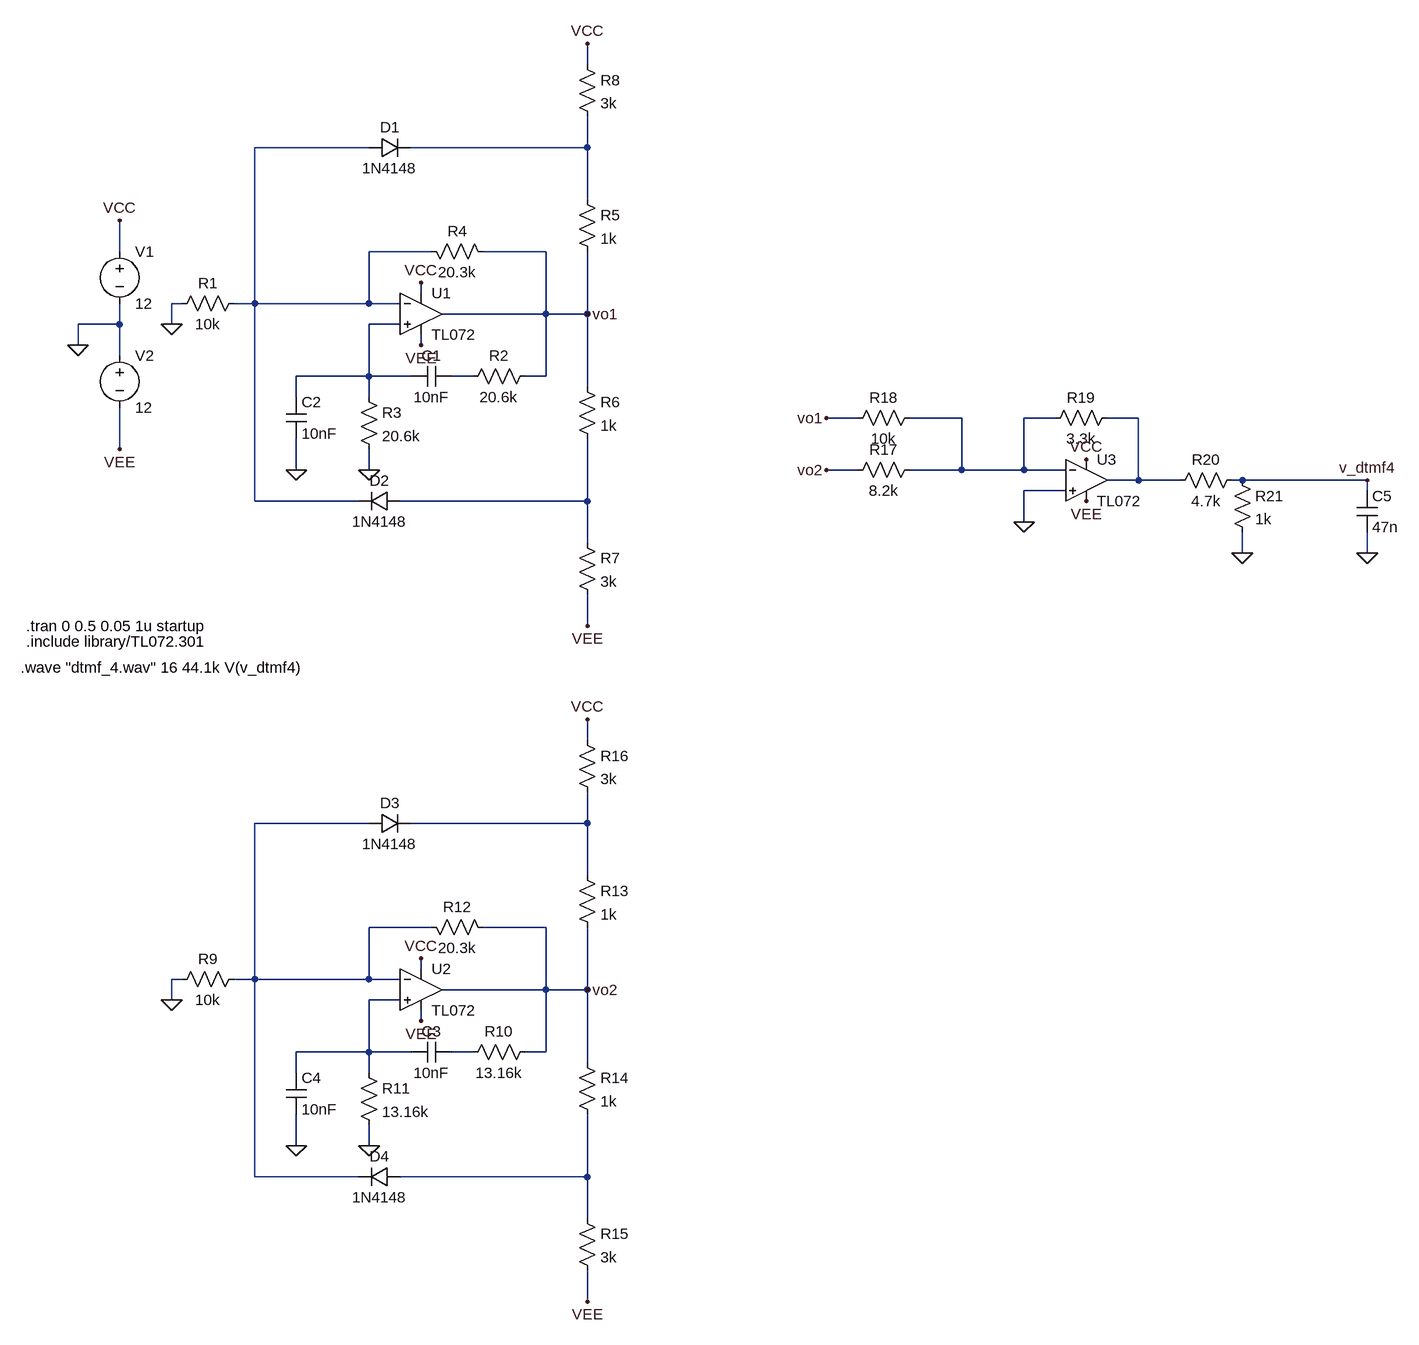
[diagram p0: schematic osilator_1.asc]
osilator_1.asc, the LTspice schematic file:
Version 4.1
SHEET 1 1556 1368
WIRE 288 -624 288 -656
WIRE -48 -496 -224 -496
WIRE 288 -496 288 -544
WIRE 288 -496 16 -496
WIRE 288 -416 288 -496
WIRE -432 -336 -432 -384
WIRE 48 -336 -48 -336
WIRE 224 -336 128 -336
WIRE 32 -272 32 -288
WIRE -336 -256 -352 -256
WIRE -224 -256 -224 -496
WIRE -224 -256 -256 -256
WIRE -48 -256 -48 -336
WIRE -48 -256 -224 -256
WIRE 0 -256 -48 -256
WIRE 224 -240 224 -336
WIRE 224 -240 64 -240
WIRE 288 -240 288 -336
WIRE 288 -240 224 -240
WIRE -432 -224 -432 -256
WIRE -432 -224 -496 -224
WIRE -352 -224 -352 -256
WIRE 0 -224 -48 -224
WIRE -496 -192 -496 -224
WIRE 32 -192 32 -208
WIRE -432 -176 -432 -224
WIRE -48 -144 -48 -224
WIRE -48 -144 -160 -144
WIRE 16 -144 -48 -144
WIRE 112 -144 80 -144
WIRE 224 -144 224 -240
WIRE 224 -144 192 -144
WIRE 288 -128 288 -240
WIRE -160 -112 -160 -144
WIRE -48 -112 -48 -144
WIRE 704 -80 656 -80
WIRE 864 -80 784 -80
WIRE 1008 -80 960 -80
WIRE 1136 -80 1088 -80
WIRE -432 -32 -432 -96
WIRE -160 0 -160 -48
WIRE -48 0 -48 -32
WIRE 704 0 656 0
WIRE 864 0 864 -80
WIRE 864 0 784 0
WIRE 960 0 960 -80
WIRE 960 0 864 0
WIRE 1024 0 960 0
WIRE 1136 16 1136 -80
WIRE 1136 16 1088 16
WIRE 1200 16 1136 16
WIRE 1296 16 1280 16
WIRE 1488 16 1296 16
WIRE 1024 32 960 32
WIRE 1488 32 1488 16
WIRE -224 48 -224 -256
WIRE -64 48 -224 48
WIRE 288 48 288 -48
WIRE 288 48 0 48
WIRE 960 80 960 32
WIRE 288 112 288 48
WIRE 1296 128 1296 96
WIRE 1488 128 1488 96
WIRE 288 240 288 192
WIRE 288 416 288 384
WIRE -48 544 -224 544
WIRE 288 544 288 496
WIRE 288 544 16 544
WIRE 288 624 288 544
WIRE 48 704 -48 704
WIRE 224 704 128 704
WIRE 32 768 32 752
WIRE -336 784 -352 784
WIRE -224 784 -224 544
WIRE -224 784 -256 784
WIRE -48 784 -48 704
WIRE -48 784 -224 784
WIRE 0 784 -48 784
WIRE 224 800 224 704
WIRE 224 800 64 800
WIRE 288 800 288 704
WIRE 288 800 224 800
WIRE -352 816 -352 784
WIRE 0 816 -48 816
WIRE 32 848 32 832
WIRE -48 896 -48 816
WIRE -48 896 -160 896
WIRE 16 896 -48 896
WIRE 112 896 80 896
WIRE 224 896 224 800
WIRE 224 896 192 896
WIRE 288 912 288 800
WIRE -160 928 -160 896
WIRE -48 928 -48 896
WIRE -160 1040 -160 992
WIRE -48 1040 -48 1008
WIRE -224 1088 -224 784
WIRE -64 1088 -224 1088
WIRE 288 1088 288 992
WIRE 288 1088 0 1088
WIRE 288 1152 288 1088
WIRE 288 1280 288 1232
FLAG -352 -224 0
FLAG -48 0 0
FLAG -160 0 0
FLAG -496 -192 0
FLAG -432 -384 VCC
FLAG 32 -288 VCC
FLAG -432 -32 VEE
FLAG 32 -192 VEE
FLAG 288 -656 VCC
FLAG 288 240 VEE
FLAG 288 -240 vo1
FLAG -352 816 0
FLAG -48 1040 0
FLAG -160 1040 0
FLAG 32 752 VCC
FLAG 32 848 VEE
FLAG 288 384 VCC
FLAG 288 1280 VEE
FLAG 288 800 vo2
FLAG 656 -80 vo1
FLAG 656 0 vo2
FLAG 960 80 0
FLAG 1056 -16 VCC
FLAG 1056 48 VEE
FLAG 1488 16 v_dtmf4
FLAG 1488 128 0
FLAG 1296 128 0
SYMBOL OpAmps\\opamp2 32 -304 R0
SYMATTR InstName U1
SYMATTR Value TL072
SYMBOL res -240 -272 R90
WINDOW 0 0 56 VBottom 2
WINDOW 3 32 56 VTop 2
SYMATTR InstName R1
SYMATTR Value 10k
SYMBOL res 208 -160 R90
WINDOW 0 0 56 VBottom 2
WINDOW 3 32 56 VTop 2
SYMATTR InstName R2
SYMATTR Value 20.6k
SYMBOL cap 80 -160 R90
WINDOW 0 0 32 VBottom 2
WINDOW 3 32 32 VTop 2
SYMATTR InstName C1
SYMATTR Value 10nF
SYMBOL res -64 -128 R0
SYMATTR InstName R3
SYMATTR Value 20.6k
SYMBOL cap -176 -112 R0
SYMATTR InstName C2
SYMATTR Value 10nF
SYMBOL res 144 -320 M270
WINDOW 0 32 56 VTop 2
WINDOW 3 0 56 VBottom 2
SYMATTR InstName R4
SYMATTR Value 20.3k
SYMBOL voltage -432 -352 R0
WINDOW 123 0 0 Left 0
WINDOW 39 0 0 Left 0
SYMATTR InstName V1
SYMATTR Value 12
SYMBOL voltage -432 -192 R0
SYMATTR InstName V2
SYMATTR Value 12
SYMBOL res 272 -432 R0
SYMATTR InstName R5
SYMATTR Value 1k
SYMBOL res 272 -144 R0
SYMATTR InstName R6
SYMATTR Value 1k
SYMBOL res 272 96 R0
SYMATTR InstName R7
SYMATTR Value 3k
SYMBOL res 272 -640 R0
SYMATTR InstName R8
SYMATTR Value 3k
SYMBOL diode -48 -480 R270
WINDOW 0 32 32 VTop 2
WINDOW 3 0 32 VBottom 2
SYMATTR InstName D1
SYMATTR Value 1N4148
SYMBOL diode 0 32 R90
WINDOW 0 0 32 VBottom 2
WINDOW 3 32 32 VTop 2
SYMATTR InstName D2
SYMATTR Value 1N4148
SYMBOL OpAmps\\opamp2 32 736 R0
SYMATTR InstName U2
SYMATTR Value TL072
SYMBOL res -240 768 R90
WINDOW 0 0 56 VBottom 2
WINDOW 3 32 56 VTop 2
SYMATTR InstName R9
SYMATTR Value 10k
SYMBOL res 208 880 R90
WINDOW 0 0 56 VBottom 2
WINDOW 3 32 56 VTop 2
SYMATTR InstName R10
SYMATTR Value 13.16k
SYMBOL cap 80 880 R90
WINDOW 0 0 32 VBottom 2
WINDOW 3 32 32 VTop 2
SYMATTR InstName C3
SYMATTR Value 10nF
SYMBOL res -64 912 R0
SYMATTR InstName R11
SYMATTR Value 13.16k
SYMBOL cap -176 928 R0
SYMATTR InstName C4
SYMATTR Value 10nF
SYMBOL res 144 720 M270
WINDOW 0 32 56 VTop 2
WINDOW 3 0 56 VBottom 2
SYMATTR InstName R12
SYMATTR Value 20.3k
SYMBOL res 272 608 R0
SYMATTR InstName R13
SYMATTR Value 1k
SYMBOL res 272 896 R0
SYMATTR InstName R14
SYMATTR Value 1k
SYMBOL res 272 1136 R0
SYMATTR InstName R15
SYMATTR Value 3k
SYMBOL res 272 400 R0
SYMATTR InstName R16
SYMATTR Value 3k
SYMBOL diode -48 560 R270
WINDOW 0 32 32 VTop 2
WINDOW 3 0 32 VBottom 2
SYMATTR InstName D3
SYMATTR Value 1N4148
SYMBOL diode 0 1072 R90
WINDOW 0 0 32 VBottom 2
WINDOW 3 32 32 VTop 2
SYMATTR InstName D4
SYMATTR Value 1N4148
SYMBOL OpAmps\\opamp2 1056 -48 R0
SYMATTR InstName U3
SYMATTR Value TL072
SYMBOL res 800 -16 R90
WINDOW 0 0 56 VBottom 2
WINDOW 3 32 56 VTop 2
SYMATTR InstName R17
SYMATTR Value 8.2k
SYMBOL res 800 -96 R90
WINDOW 0 0 56 VBottom 2
WINDOW 3 32 56 VTop 2
SYMATTR InstName R18
SYMATTR Value 10k
SYMBOL res 1104 -96 R90
WINDOW 0 0 56 VBottom 2
WINDOW 3 32 56 VTop 2
SYMATTR InstName R19
SYMATTR Value 3.3k
SYMBOL res 1296 0 R90
WINDOW 0 0 56 VBottom 2
WINDOW 3 32 56 VTop 2
SYMATTR InstName R20
SYMATTR Value 4.7k
SYMBOL cap 1472 32 R0
SYMATTR InstName C5
SYMATTR Value 47n
SYMBOL res 1280 0 R0
SYMATTR InstName R21
SYMATTR Value 1k
TEXT -576 264 Left 2 !.include library/TL072.301
TEXT -576 240 Left 2 !.tran 0 0.5 0.05 1u startup
TEXT -584 304 Left 2 !.wave "dtmf_4.wav" 16 44.1k V(v_dtmf4)

The netlist it stands for:
* osilator_1.asc
X§U1 N003 N001 VCC VEE vo1 TL072  ; pins In+ In- V+ V- OUT
R1 N001 0 10k
R2 vo1 N004 20.6k
C1 N004 N003 10nF
R3 N003 0 20.6k
C2 N003 0 10nF
R4 vo1 N001 20.3k
V1 VCC 0 12
V2 0 VEE 12
R5 N002 vo1 1k
R6 vo1 N007 1k
R7 N007 VEE 3k
R8 VCC N002 3k
D1 N001 N002 1N4148
D2 N007 N001 1N4148
X§U2 N010 N008 VCC VEE vo2 TL072  ; pins In+ In- V+ V- OUT
R9 N008 0 10k
R10 vo2 N011 13.16k
C3 N011 N010 10nF
R11 N010 0 13.16k
C4 N010 0 10nF
R12 vo2 N008 20.3k
R13 N009 vo2 1k
R14 vo2 N012 1k
R15 N012 VEE 3k
R16 VCC N009 3k
D3 N008 N009 1N4148
D4 N012 N008 1N4148
X§U3 0 N005 VCC VEE N006 TL072  ; pins In+ In- V+ V- OUT
R17 N005 vo2 8.2k
R18 N005 vo1 10k
R19 N006 N005 3.3k
R20 v_dtmf4 N006 4.7k
C5 v_dtmf4 0 47n
R21 v_dtmf4 0 1k
.model D D
.lib standard.dio
.include library/TL072.301
.tran 0 0.5 0.05 1u startup
.wave "dtmf_4.wav" 16 44.1k V(v_dtmf4)
.backanno
.end